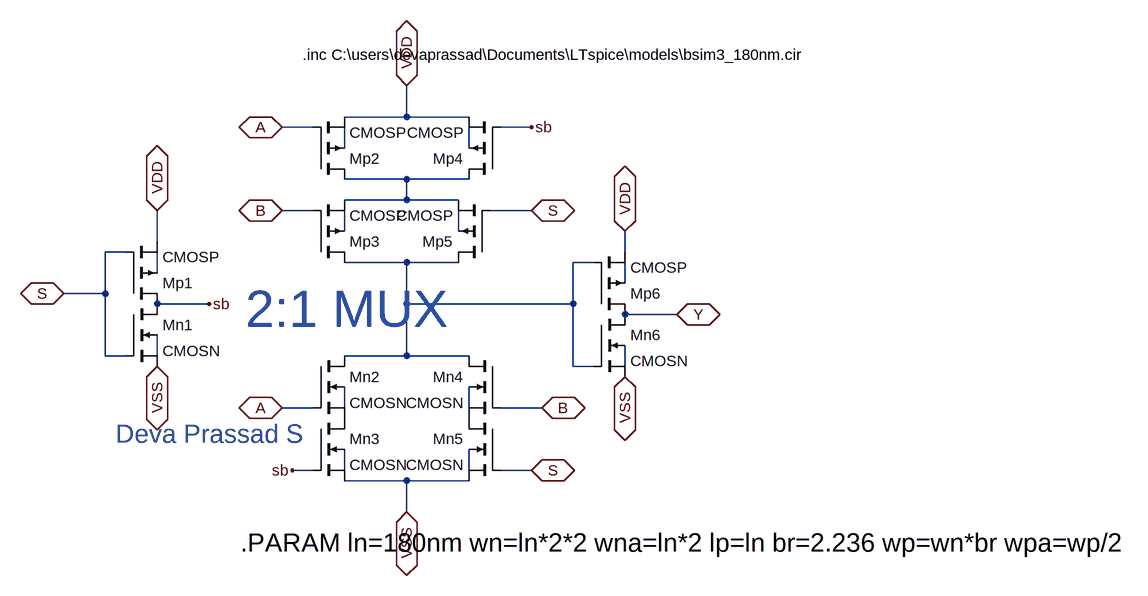
[diagram p0: schematic mux21.asc]
mux21.asc, the LTspice schematic file:
Version 4.1
SHEET 1 880 680
WIRE -32 -64 -32 -112
WIRE -32 -64 -128 -64
WIRE 64 -64 -32 -64
WIRE -176 -48 -224 -48
WIRE 160 -48 112 -48
WIRE -128 -16 -128 -48
WIRE 64 -16 64 -48
WIRE -32 32 -128 32
WIRE 64 32 -32 32
WIRE -32 64 -32 32
WIRE -32 64 -128 64
WIRE 48 64 -32 64
WIRE -176 80 -224 80
WIRE 160 80 96 80
WIRE -128 112 -128 80
WIRE 48 112 48 80
WIRE -416 128 -416 80
WIRE -464 144 -496 144
WIRE 304 144 304 112
WIRE -32 160 -128 160
WIRE 48 160 -32 160
WIRE 256 160 224 160
WIRE -416 176 -416 144
WIRE 304 192 304 160
WIRE -496 208 -496 144
WIRE -496 208 -560 208
WIRE -336 224 -416 224
WIRE -32 224 -32 160
WIRE 224 224 224 160
WIRE 224 224 -32 224
WIRE 384 240 304 240
WIRE -496 304 -496 208
WIRE -464 304 -496 304
WIRE -416 304 -416 272
WIRE -32 304 -32 224
WIRE -32 304 -128 304
WIRE 64 304 -32 304
WIRE 224 320 224 224
WIRE 256 320 224 320
WIRE 304 320 304 288
WIRE -176 384 -224 384
WIRE -128 384 -128 352
WIRE 64 384 64 352
WIRE 176 384 112 384
WIRE -176 480 -208 480
WIRE -128 480 -128 448
WIRE 64 480 64 448
WIRE 160 480 112 480
WIRE -32 496 -128 496
WIRE 64 496 -32 496
WIRE -32 544 -32 496
FLAG -32 544 VSS
IOPIN -32 544 BiDir
FLAG -32 -112 VDD
IOPIN -32 -112 BiDir
FLAG 176 384 B
IOPIN 176 384 BiDir
FLAG -224 384 A
IOPIN -224 384 BiDir
FLAG -416 320 VSS
IOPIN -416 320 BiDir
FLAG -416 80 VDD
IOPIN -416 80 BiDir
FLAG -560 208 S
IOPIN -560 208 BiDir
FLAG -336 224 sb
FLAG -208 480 sb
FLAG 160 480 S
IOPIN 160 480 BiDir
FLAG 160 -48 sb
FLAG -224 -48 A
IOPIN -224 -48 BiDir
FLAG 160 80 S
IOPIN 160 80 BiDir
FLAG -224 80 B
IOPIN -224 80 BiDir
FLAG 304 336 VSS
IOPIN 304 336 BiDir
FLAG 384 240 Y
IOPIN 384 240 BiDir
FLAG 304 112 VDD
IOPIN 304 112 BiDir
SYMBOL pmos4 -176 32 M180
SYMATTR InstName Mp2
SYMATTR Value2 l={lp} w={wp} ad={lp*wp} as={lp*wp} pd={2*lp+wp} ps={2*lp+wp}
SYMATTR Value CMOSP
SYMBOL nmos4 -176 304 R0
SYMATTR InstName Mn2
SYMATTR Value2 l={ln} w={wn} ad={ln*wn} as={ln*wn} pd={2*ln+wn} ps={2*ln+wn}
SYMATTR Value CMOSN
SYMBOL pmos4 96 160 R180
SYMATTR InstName Mp5
SYMATTR Value2 l={lp} w={wp} ad={lp*wp} as={lp*wp} pd={2*lp+wp} ps={2*lp+wp}
SYMATTR Value CMOSP
SYMBOL pmos4 -176 160 M180
SYMATTR InstName Mp3
SYMATTR Value2 l={lp} w={wp} ad={lp*wp} as={lp*wp} pd={2*lp+wp} ps={2*lp+wp}
SYMATTR Value CMOSP
SYMBOL pmos4 -464 224 M180
SYMATTR InstName Mp1
SYMATTR Value2 l={lp} w={wpa} ad={lp*wpa} as={lp*wpa} pd={2*lp+wpa} ps={2*lp+wpa}
SYMATTR Value CMOSP
SYMBOL pmos4 256 240 M180
SYMATTR InstName Mp6
SYMATTR Value2 l={lp} w={wpa} ad={lp*wpa} as={lp*wpa} pd={2*lp+wpa} ps={2*lp+wpa}
SYMATTR Value CMOSP
SYMBOL pmos4 112 32 R180
SYMATTR InstName Mp4
SYMATTR Value2 l={lp} w={wp} ad={lp*wp} as={lp*wp} pd={2*lp+wp} ps={2*lp+wp}
SYMATTR Value CMOSP
SYMBOL nmos4 -176 400 R0
SYMATTR InstName Mn3
SYMATTR Value2 l={ln} w={wn} ad={ln*wn} as={ln*wn} pd={2*ln+wn} ps={2*ln+wn}
SYMATTR Value CMOSN
SYMBOL nmos4 -464 224 R0
SYMATTR InstName Mn1
SYMATTR Value2 l={ln} w={wna} ad={ln*wna} as={ln*wna} pd={2*ln+wna} ps={2*ln+wna}
SYMATTR Value CMOSN
SYMBOL nmos4 256 240 R0
SYMATTR InstName Mn6
SYMATTR Value2 l={ln} w={wna} ad={ln*wna} as={ln*wna} pd={2*ln+wna} ps={2*ln+wna}
SYMATTR Value CMOSN
SYMBOL nmos4 112 304 M0
SYMATTR InstName Mn4
SYMATTR Value2 l={ln} w={wn} ad={ln*wn} as={ln*wn} pd={2*ln+wn} ps={2*ln+wn}
SYMATTR Value CMOSN
SYMBOL nmos4 112 400 M0
SYMATTR InstName Mn5
SYMATTR Value2 l={ln} w={wn} ad={ln*wn} as={ln*wn} pd={2*ln+wn} ps={2*ln+wn}
SYMATTR Value CMOSN
TEXT -280 232 Left 6 ;2:1 MUX
TEXT -480 424 Left 4 ;Deva Prassad S
TEXT -192 -160 Left 2 !.inc C:\\users\\devaprassad\\Documents\\LTspice\\models\\bsim3_180nm.cir
TEXT -288 592 Left 4 !.PARAM ln=180nm wn=ln*2*2 wna=ln*2 lp=ln br=2.236 wp=wn*br wpa=wp/2

The netlist it stands for:
* mux21.asc
Mp2 N003 A VDD N001 CMOSP l={lp} w={wp} ad={lp*wp} as={lp*wp} pd={2*lp+wp} ps={2*lp+wp}
Mn2 N006 A P001 N011 CMOSN l={ln} w={wn} ad={ln*wn} as={ln*wn} pd={2*ln+wn} ps={2*ln+wn}
Mp5 N006 S N003 N005 CMOSP l={lp} w={wp} ad={lp*wp} as={lp*wp} pd={2*lp+wp} ps={2*lp+wp}
Mp3 N006 B N003 N004 CMOSP l={lp} w={wp} ad={lp*wp} as={lp*wp} pd={2*lp+wp} ps={2*lp+wp}
Mp1 sb S VDD N007 CMOSP l={lp} w={wpa} ad={lp*wpa} as={lp*wpa} pd={2*lp+wpa} ps={2*lp+wpa}
Mp6 Y N006 VDD N008 CMOSP l={lp} w={wpa} ad={lp*wpa} as={lp*wpa} pd={2*lp+wpa} ps={2*lp+wpa}
Mp4 N003 sb VDD N002 CMOSP l={lp} w={wp} ad={lp*wp} as={lp*wp} pd={2*lp+wp} ps={2*lp+wp}
Mn3 P001 sb VSS N013 CMOSN l={ln} w={wn} ad={ln*wn} as={ln*wn} pd={2*ln+wn} ps={2*ln+wn}
Mn1 sb S VSS N009 CMOSN l={ln} w={wna} ad={ln*wna} as={ln*wna} pd={2*ln+wna} ps={2*ln+wna}
Mn6 Y N006 VSS N010 CMOSN l={ln} w={wna} ad={ln*wna} as={ln*wna} pd={2*ln+wna} ps={2*ln+wna}
Mn4 N006 B P002 N012 CMOSN l={ln} w={wn} ad={ln*wn} as={ln*wn} pd={2*ln+wn} ps={2*ln+wn}
Mn5 P002 S VSS N014 CMOSN l={ln} w={wn} ad={ln*wn} as={ln*wn} pd={2*ln+wn} ps={2*ln+wn}
.model NMOS NMOS
.model PMOS PMOS
.lib standard.mos
* 2:1 MUX
* Deva Prassad S
.inc C:\users\devaprassad\Documents\LTspice\models\bsim3_180nm.cir
.PARAM ln=180nm wn=ln*2*2 wna=ln*2 lp=ln br=2.236 wp=wn*br wpa=wp/2
.backanno
.end